# Altium project Weather_Data.PrjPcb (part 1 of 2)
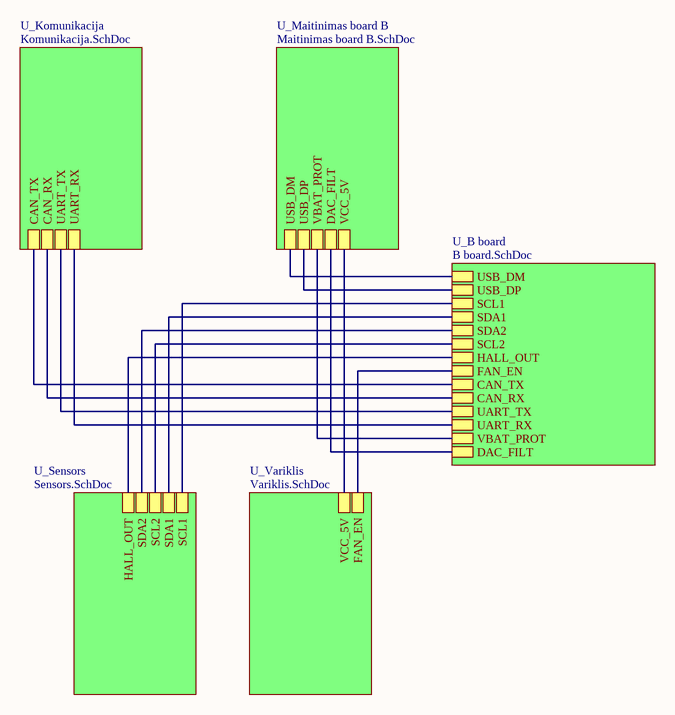
[diagram p0: B_Top.SchDoc]
6 sheets, 175 parts. Net scope: hierarchical (ports join the sheet entries above them; power ports are global).
Sheets:
  B_Top.SchDoc
    U_B board = B board.SchDoc
    U_Maitinimas board B = Maitinimas board B.SchDoc
    U_Komunikacija = Komunikacija.SchDoc
    U_Sensors = Sensors.SchDoc
    U_Variklis = Variklis.SchDoc

## Sheet B_Top.SchDoc
size A4; SheetNumber: 1; SheetTotal: 6

### Sub-sheets
U_B board = B board.SchDoc: USB_DM, USB_DP, SCL1, SDA1, SDA2, SCL2, HALL_OUT, FAN_EN, CAN_TX, CAN_RX, UART_TX, UART_RX, VBAT_PROT, DAC_FILT
U_Komunikacija = Komunikacija.SchDoc: CAN_TX, CAN_RX, UART_TX, UART_RX
U_Maitinimas board B = Maitinimas board B.SchDoc: USB_DM, USB_DP, VBAT_PROT, DAC_FILT, VCC_5V
U_Sensors = Sensors.SchDoc: SCL1, SDA1, SCL2, SDA2, HALL_OUT
U_Variklis = Variklis.SchDoc: FAN_EN, VCC_5V

### Nets
SCL1: sheet U_B board/SCL1, sheet U_Sensors/SCL1
SCL2: sheet U_B board/SCL2, sheet U_Sensors/SCL2
SDA1: sheet U_B board/SDA1, sheet U_Sensors/SDA1
SDA2: sheet U_B board/SDA2, sheet U_Sensors/SDA2
VBAT_PROT: sheet U_B board/VBAT_PROT, sheet U_Maitinimas board B/VBAT_PROT
VCC_5V: sheet U_Maitinimas board B/VCC_5V, sheet U_Variklis/VCC_5V
NetC17_2: sheet U_B board/DAC_FILT, sheet U_Maitinimas board B/DAC_FILT
NetIC1_4: sheet U_B board/USB_DM, sheet U_Maitinimas board B/USB_DM
NetIC1_6: sheet U_B board/USB_DP, sheet U_Maitinimas board B/USB_DP
NetIC2_2: sheet U_B board/HALL_OUT, sheet U_Sensors/HALL_OUT
NetIC5_4: sheet U_B board/UART_RX, sheet U_Komunikacija/UART_RX
NetIC5_6: sheet U_B board/UART_TX, sheet U_Komunikacija/UART_TX
NetR28_1: sheet U_B board/FAN_EN, sheet U_Variklis/FAN_EN
NetU4_35: sheet U_B board/CAN_TX, sheet U_Komunikacija/CAN_TX
NetU4_58: sheet U_B board/CAN_RX, sheet U_Komunikacija/CAN_RX

## Sheet B board.SchDoc
size A3; SheetNumber: 2; SheetTotal: 6
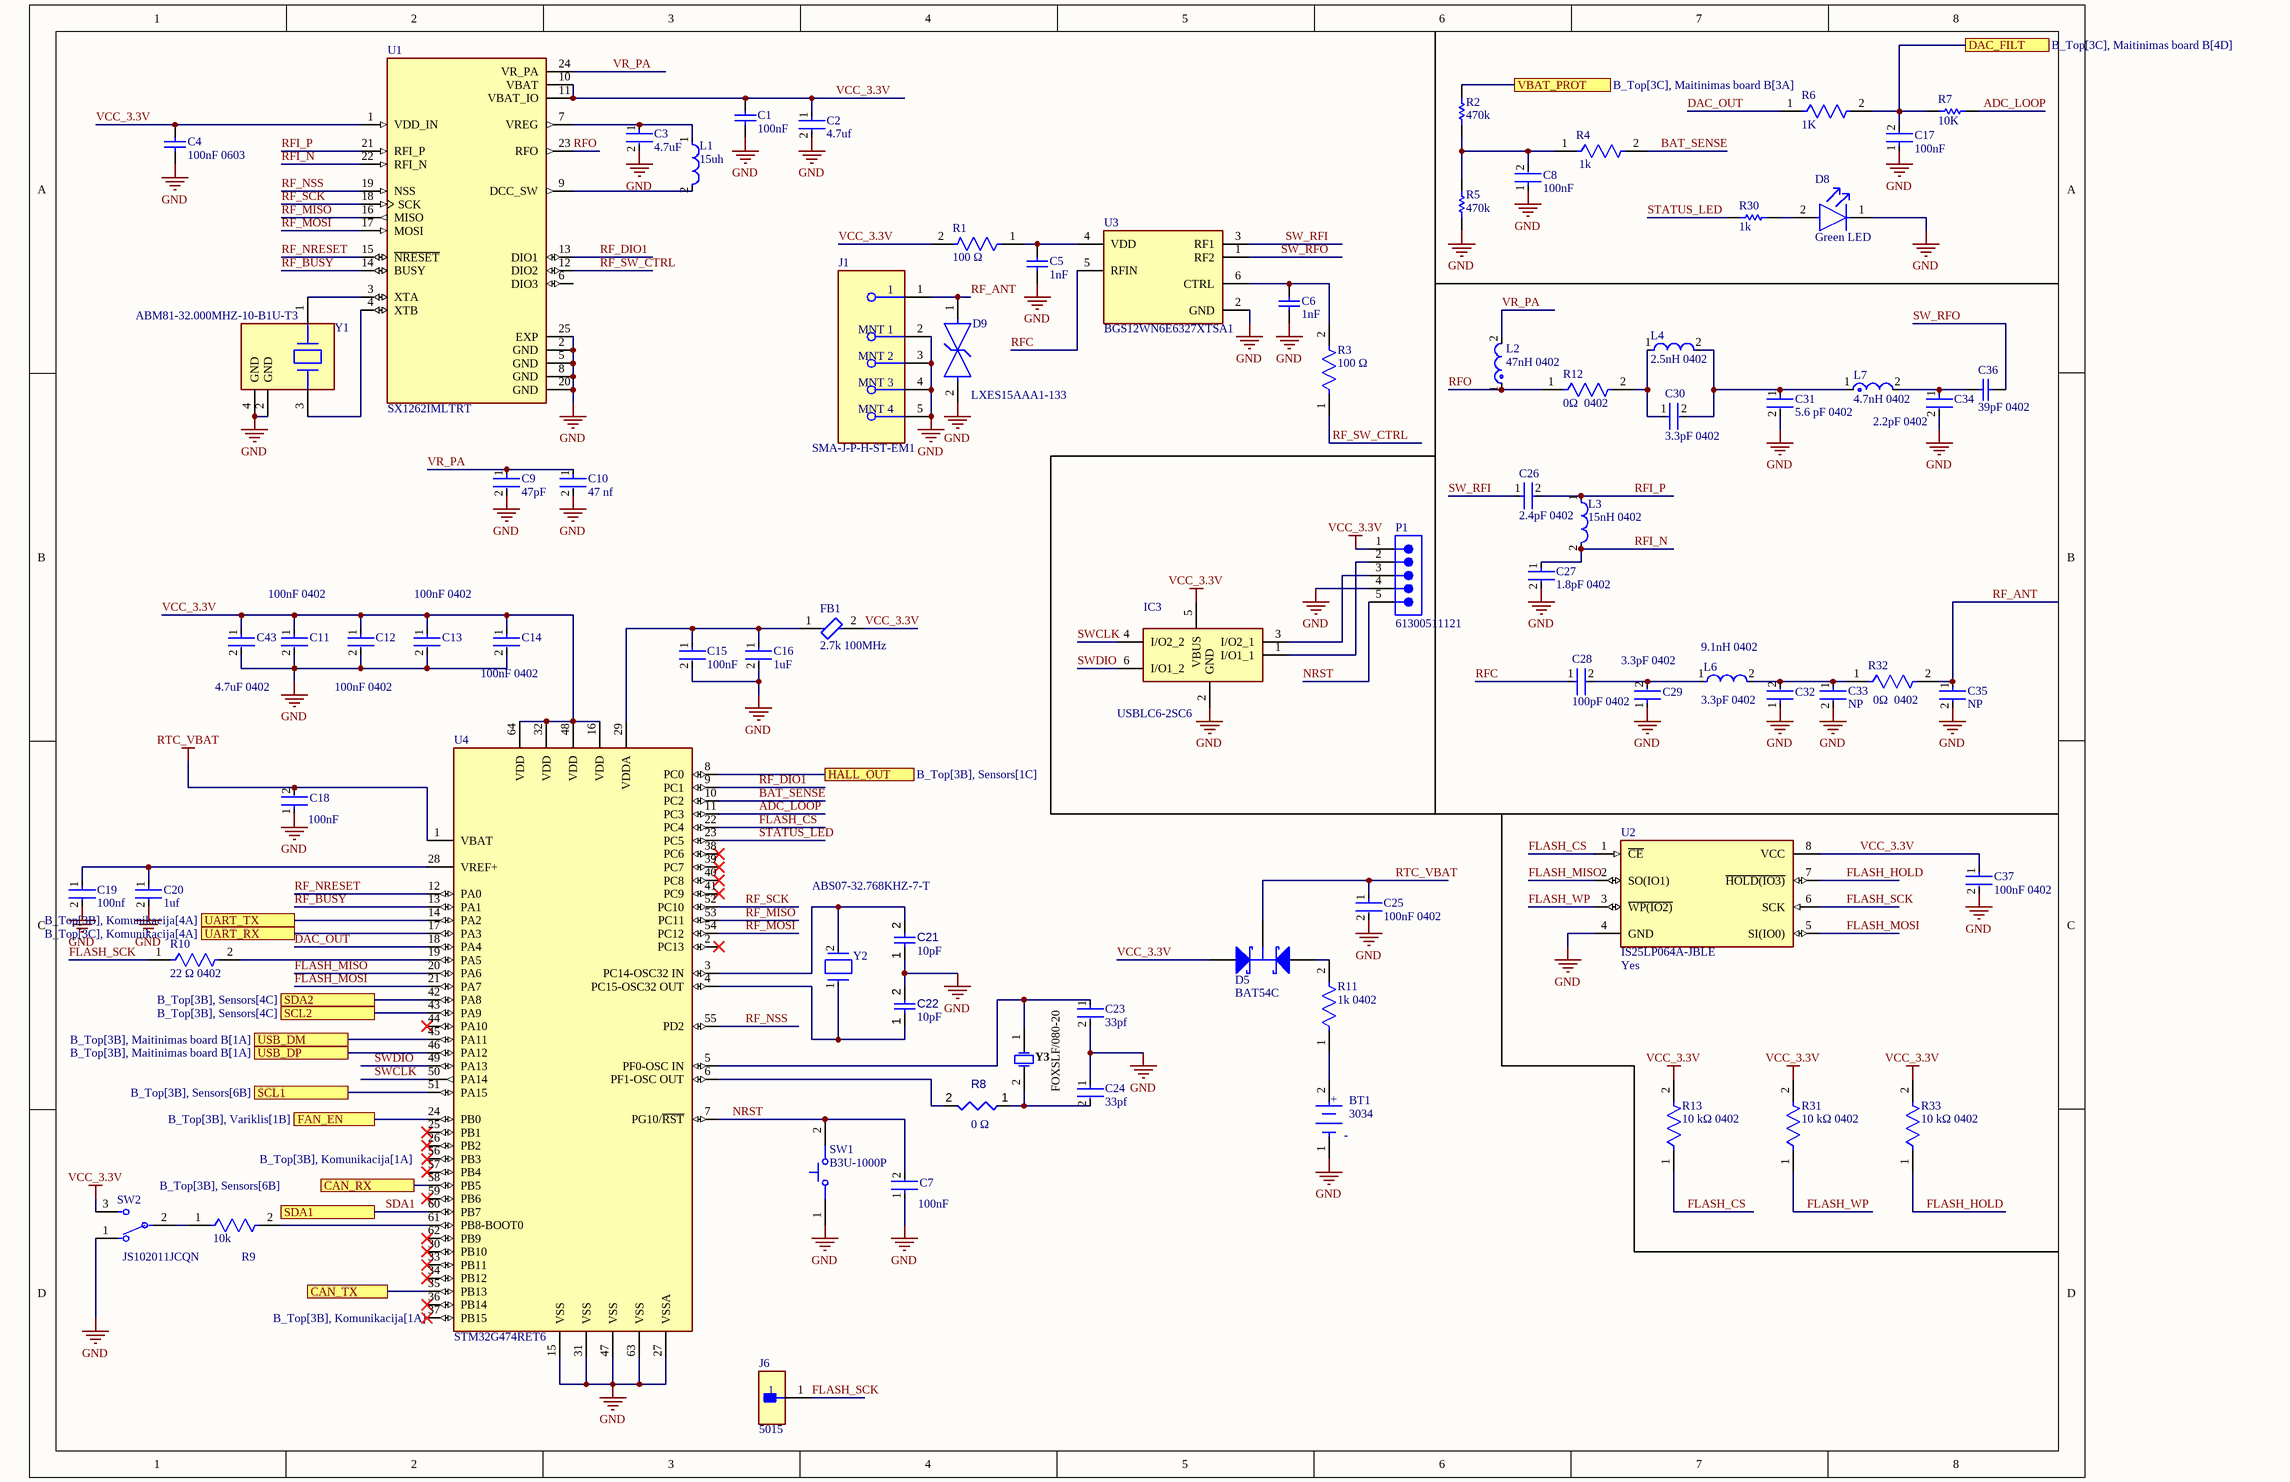
[diagram p1: B board.SchDoc]

### Parts
BT1  3034  [FP-3034-MFG]
C1  100nF  [CAPC1608X90X35NL15T15]
C2  4.7uf  [FP-CC1206-1_25-MFG]
C3  4.7uF  [FP-CC1206-1_25-MFG]
C4  100nF 0603  [CAPC1608X90X35NL15T15]
C5  1nF  [CAPC1005X60X30ML05T10]
C6  1nF  [CAPC1005X60X30ML05T10]
C7  100nF  [FP-GRT155-0_05-IPC_B]
C8  100nF  [FP-GRT155-0_05-IPC_B]
C9  47pF  [FP-CC0402-0_05-0_55-L2_0-MFG]
C10  47 nf  [FP-C0402-BB-MFG]
C11  100nF 0402  [FP-GRT155-0_05-IPC_B]
C12  100nF 0402  [FP-GRT155-0_05-IPC_B]
C13  100nF 0402  [FP-GRT155-0_05-IPC_B]
C14  100nF 0402  [FP-GRT155-0_05-IPC_B]
C15  100nF  [FP-GRT155-0_05-IPC_B]
C16  1uF  [FP-CL440-IPC_C]
C17  100nF  [FP-GRT155-0_05-IPC_B]
C18  100nF  [FP-GRT155-0_05-IPC_B]
C19  100nf  [FP-0402B104K500CT-IPC_C]
C20  1uf  [FP-CL858-IPC_C]
C21  value 10pF  [CAPC1608X90X40ML10T20]  (hidden comment: Capacitor 10 pF +/- 5% 50 V 0603)
C22  value 10pF  [CAPC1608X90X40ML10T20]  (hidden comment: Capacitor 10 pF +/- 5% 50 V 0603)
C23  33pf  [FP-CC0402-MFG]
C24  33pf  [FP-CC0402-MFG]
C25  100nF 0402  [FP-CC0402-MFG]
C26  2.4pF 0402  [FP-GJM155-0_05-IPC_A]
C27  1.8pF 0402  [FP-GJM155-0_05-IPC_B]
C28  100pF 0402  [FP-CC0402-MFG]
C29  3.3pF 0402  [FP-GJM155-0_05-IPC_B]
C30  3.3pF 0402  [FP-GJM155-0_05-IPC_B]
C31  5.6 pF 0402  [FP-GJM155-0_05-MFG]
C32  3.3pF 0402  [FP-GJM155-0_05-IPC_B]
C33  NP  [FP-GJM155-0_05-IPC_B]
C34  2.2pF 0402  [FP-GJM155-0_05-IPC_C]
C35  NP  [FP-GJM155-0_05-IPC_B]
C36  39pF 0402  [CAPC1005X55X25LL05T10]
C37  100nF 0402  [FP-CC0402-MFG]
C43  4.7uF 0402  [FP-CC0402-MFG]
D5  BAT54C  [NXP-SOT23-3_V]
D8  Green LED  [FP-LTST-C171GKT-MFG]
D9  LXES15AAA1-133  [FP-LXES15-MFG]
FB1  2.7k 100MHz  [FP-BLM21-0_2-t1_25-e0_3-IPC_A]
IC3  USBLC6-2SC6  [SOT95P280X145-6N]
J1  SMA-J-P-H-ST-EM1  [FP-SMA-J-P-H-ST-EM1-MFG]
J6  5015  [FP-5015-MFG]
L1  15uh  [FP-MLZ2012-1_25-IPC_C]
L2  47nH 0402  [FP-LQG15WH_02-IPC_C]
L3  15nH 0402  [FP-LQW15AN_00-W0_6-0_1-MFG]
L4  2.5nH 0402  [FP-LQW15AN_00-W0_6-0_1-MFG]
L6  9.1nH 0402  [FP-LQW15AN_00-W0_6-0_1-MFG]
L7  4.7nH 0402  [FP-LQG15HH_02-IPC_B]
P1  61300511121  [61300511121]
R1  100 Ω  [FP-CRGCQ0402-IPC_C]
R2  470k  [RESC1005X40X25ML10T10]
R3  100 Ω  [FP-CRGCQ0402-IPC_C]
R4  1k  [FP-CRGCQ0402-IPC_C]
R5  470k  [RESC1005X40X25ML10T10]
R6  1K  [FP-CRGCQ0402-IPC_C]
R7  10K  [RESC1005X40X25ML05T05]
R8  0 Ω  [RESC0402(1005)_L]
R9  10k  [FP-ESR01-MFG]
R10  22 Ω 0402  [FP-RMCF0402-MFG]
R11  1k 0402  [FP-CRCW0402-e3-MFG]
R12  0Ω  0402  [FP-CRCW0402-e3-IPC_C]
R13  10 kΩ 0402  [FP-AC0402-MFG]
R30  1k  [RESC1005X40X25ML10T10]
R31  10 kΩ 0402  [FP-AC0402-MFG]
R32  0Ω  0402  [FP-CRCW0402-e3-IPC_C]
R33  10 kΩ 0402  [FP-AC0402-MFG]
SW1  B3U-1000P  [OMRON-B3U-1000_V]
SW2  JS102011JCQN  [FP-JS102011JCQN-MFG]
U1  SX1262IMLTRT  [QFN50P400X400X100-25N]
U2  IS25LP064A-JBLE  RoHS Compliant: Yes  [FP-SOP-8-5280X5280DE-IPC_C]
U3  BGS12WN6E6327XTSA1  [FP-PG-TSNP-6-MFG]
U4  STM32G474RET6  [FP-LQFP64-5W-MFG]
Y1  ABM81-32.000MHZ-10-B1U-T3  [FP-ABM81-MFG]
Y2  ABS07-32.768KHZ-7-T  [FP-ABS07-MFG]
Y3  FOXSLF/080-20  [FOX-FOXSLF080-20]

### Ports
CAN_RX (see B_Top[3B], Komunikacija[1A]), CAN_TX (see B_Top[3B], Komunikacija[1A]), DAC_FILT (see B_Top[3C], Maitinimas board B[4D]), FAN_EN (see B_Top[3B], Variklis[1B]), HALL_OUT (see B_Top[3B], Sensors[1C]), SCL1 (see B_Top[3B], Sensors[6B]), SCL2 (see B_Top[3B], Sensors[4C]), SDA1 (see B_Top[3B], Sensors[6B]), SDA2 (see B_Top[3B], Sensors[4C]), UART_RX (see B_Top[3C], Komunikacija[4A]), UART_TX (see B_Top[3B], Komunikacija[4A]), USB_DM (see B_Top[3B], Maitinimas board B[1A]), USB_DP (see B_Top[3B], Maitinimas board B[1A]), VBAT_PROT (see B_Top[3C], Maitinimas board B[3A])

### Nets
GND: BT1.1(C) C1.1 C2.2 C3.2 C4.1 C5.1 C6.1 C7.1 C8.1 C9.2 C10.2 C11.2 C12.2 C13.2 C14.2 C15.2 C16.2 C17.1 C18.1 C19.2 C20.2 C21.1 C22.2 C23.2 C24.1 C25.2 C27.2 C29.1 C31.2 C32.1 C33.2 C34.2 C35.2 C37.2 C43.2 D8.1(C) D9.2 IC3.2(GND) J1.2(MNT_1) J1.3(MNT_2) J1.4(MNT_3) J1.5(MNT_4) P1.4 R5.1 SW1.1 SW2.1 U1.2(GND) U1.5(GND) U1.8(GND) U1.20(GND) U1.25(EXP) U2.4(GND) U3.2(GND) U4.15(VSS) U4.27(VSSA) U4.31(VSS) U4.47(VSS) U4.63(VSS) Y1.2(GND) Y1.4(GND)
RTC_VBAT: C18.2 C25.1 D5.3(K) U4.1(VBAT)
VCC_3.3V: C1.2 C2.1 C4.2 C11.1 C12.1 C13.1 C14.1 C37.1 C43.1 D5.1(A) FB1.2 IC3.5(VBUS) P1.1 R1.2 R13.2 R31.2 R33.2 SW2.3 U1.1(VDD_IN) U1.10(VBAT) U1.11(VBAT_IO) U2.8(VCC) U4.16(VDD) U4.32(VDD) U4.48(VDD) U4.64(VDD)
ADC_LOOP: R7.2 U4.11(PC3)
BAT_SENSE: R4.2 U4.10(PC2)
DAC_OUT: R6.1 U4.18(PA4)
FLASH_CS: R13.1 U2.1(~{CE}) U4.22(PC4)
FLASH_HOLD: R33.1 U2.7(~{HOLD(IO3)})
FLASH_MISO: U2.2(SO(IO1)) U4.20(PA6)
FLASH_MOSI: U2.5(SI(IO0)) U4.21(PA7)
FLASH_SCK: J6.1 R10.1 U2.6(SCK)
FLASH_WP: R31.1 U2.3(~{WP(IO2)})
NRST: C7.2 P1.5 SW1.2 U4.7(PG10/~{RST})
RF_ANT: C35.1 D9.1 J1.1 R32.2
RF_BUSY: U1.14(BUSY) U4.13(PA1)
RF_DIO1: U1.13(DIO1) U4.9(PC1)
RF_MISO: U1.16(MISO) U4.53(PC11)
RF_MOSI: U1.17(MOSI) U4.54(PC12)
RF_NRESET: U1.15(~{NRESET}) U4.12(PA0)
RF_NSS: U1.19(NSS) U4.55(PD2)
RF_SCK: U1.18(SCK) U4.52(PC10)
RF_SW_CTRL: R3.1 U1.12(DIO2)
RFC: C28.1 U3.5(RFIN)
RFI_N: C27.1 L3.2 U1.22(RFI_N)
RFI_P: C26.2 L3.1 U1.21(RFI_P)
RFO: L2.1 R12.1 U1.23(RFO)
SCL1: U4.51(PA15) ; port SCL1
SCL2: U4.43(PA9) ; port SCL2
SDA1: U4.60(PB7) ; port SDA1
SDA2: U4.42(PA8) ; port SDA2
STATUS_LED: R30.1 U4.23(PC5)
SW_RFI: C26.1 U3.3(RF1)
SW_RFO: C36.2 U3.1(RF2)
SWCLK: IC3.4(I/O2_2) U4.50(PA14)
SWDIO: IC3.6(I/O1_2) U4.49(PA13)
VBAT_PROT: R2.2 ; port VBAT_PROT
VR_PA: C9.1 C10.1 L2.2 U1.24(VR_PA)
NetBT1_2: BT1.2(A) R11.1
NetC3_1: C3.1 L1.1 U1.7(VREG)
NetC5_2: C5.2 R1.1 U3.4(VDD)
NetC6_2: C6.2 R3.2 U3.6(CTRL)
NetC8_2: C8.2 R2.1 R4.1 R5.2
NetC15_1: C15.1 C16.1 FB1.1 U4.29(VDDA)
NetC17_2: C17.2 R6.2 R7.1 ; port DAC_FILT
NetC19_1: C19.1 C20.1 U4.28(VREF+)
NetC21_2: C21.2 U4.3(PC14-OSC32_IN) Y2.2
NetC22_1: C22.1 U4.4(PC15-OSC32_OUT) Y2.1
NetC23_1: C23.1 U4.5(PF0-OSC_IN) Y3.1
NetC24_2: C24.2 R8.1 Y3.2
NetC28_2: C28.2 C29.2 L6.1
NetC30_1: C30.1 L4.1 R12.2
NetC30_2: C30.2 C31.1 L4.2 L7.1
NetC32_2: C32.2 C33.1 L6.2 R32.1
NetC34_1: C34.1 C36.1 L7.2
NetD5_2: D5.2(A) R11.2
NetD8_2: D8.2(A) R30.2
NetIC1_4: U4.45(PA11) ; port USB_DM
NetIC1_6: U4.46(PA12) ; port USB_DP
NetIC2_2: U4.8(PC0) ; port HALL_OUT
NetIC3_1: IC3.1(I/O1_1) P1.2
NetIC3_3: IC3.3(I/O2_1) P1.3
NetIC5_4: U4.17(PA3) ; port UART_RX
NetIC5_6: U4.14(PA2) ; port UART_TX
NetL1_2: L1.2 U1.9(DCC_SW)
NetR8_2: R8.2 U4.6(PF1-OSC_OUT)
NetR9_1: R9.1 SW2.2
NetR9_2: R9.2 U4.61(PB8-BOOT0)
NetR10_2: R10.2 U4.19(PA5)
NetR28_1: U4.24(PB0) ; port FAN_EN
NetU1_3: U1.3(XTA) Y1.1
NetU1_4: U1.4(XTB) Y1.3
NetU4_35: U4.35(PB13) ; port CAN_TX
NetU4_58: U4.58(PB5) ; port CAN_RX

Not connected (* = marked no-connect by the designer): U1 6(DIO3); U4 2(PC13)* 25(PB1)* 26(PB2)* 30(PB10)* 33(PB11)* 34(PB12)* 36(PB14)* 37(PB15)* 38(PC6)* 39(PC7)* 40(PC8)* 41(PC9)* 44(PA10)* 56(PB3)* 57(PB4)* 59(PB6)* 62(PB9)*

### Notes on the sheet
- (in symbol CMP-19636-000006-1) +; -

### Library data of the parts
BT1 = CMP-19636-000006-1: BATTERY RETAINER COIN 20MM SMD; Manufacturer: Keystone Electronics; Number Of Contacts: 2; Height: 4.31mm; Device Class L1: Connectors; Device Class L3: unset; RoHS: TRUE; Automotive: No; Mouser Description: Coin Cell Battery Holders COIN CELL RETAINER; Contact Material: Nickel; Digikey Description: BATTERY RETAINER COIN 20MM SMD; Category: Batt; Package: 3034; ComponentLink2URL: https://www.keyelco.com/product-pdf.cfm?p=798; Manufacturer Part Number: 3034; Octopart: https://octopart.com/3034-keystone-27554462; ComponentLink2Description: Datasheet; Device Class L2: unset; Lead Free: Yes
C1 C4 = CMP-2006-02299-1: Part Number: C0603C104K4RAC7013; Manufacturer: Kemet
C2 C3 = CMP-03422-000808-1: CC1206 4.7 uF X7R 10.00%25 V; Manufacturer Part Number: CC1206KFX7R8BB475; Manufacturer: Yageo; Automotive Grade: NA; Material: Ceramic; Voltage Rating: 25 V; Tolerance: 0.1; Temperature Coefficient: 15%; Device Class L2: Capacitors; Device Class L1: Passive Components; Category: Cap; Automotive: No; Capacitance: 4.7 uF; ComponentLink2URL: http://www.yageo.com/documents/recent/UPY-NP0X7R_HV_1KV-to-3KV_11.pdf; Octopart: https://octopart.com/cc1206kfx7r8bb475-yageo-80904472; Value: 4.7 uF; Footprint Url: http://www.yageo.com/exep/pages/download/literatures/UPY-C_GEN_24.pdf; Lead Free: Yes; Temperature Characteristic: X7R; ComponentLink2Description: Datasheet; Temperature Range Low: -55°C; Package: CC1206-1.25; RoHS: TRUE; Device Class L3: Ceramic Capacitors; Temperature: -55°C to +125°C; Height: 1.45mm; Temperature Range High: +125°C
C5 C6 = CMP-1034-01610-2: Part Number: C0402C102K9RACTU; Manufacturer: Kemet
C7 C8 C11-C15 C17 C18 = CMP-06035-021603-1: Multi-Layer Ceramic Capacitor 100nF 25V X7R ±10% 0402 Paper T/R
C9 = CMP-00621-00192874-1: CC0402JRNPO9BN470 Multilayer Ceramic Capacitor, 47 pF, 50 V, ± 5%, C0G (NP0), 0402 [1005 Metric]; NexarPartId: 192874; Temperature Coefficient: 30ppm/°C; Voltage: 50V; Insulation Resistance: 100GΩ; Termination: SMD/SMT; Thickness: 558.8µm; RoHS: Compliant; Length: 1mm; Halogen Free: Halogen Free; Lead Free: Lead Free; Material: Ceramic; Number of Pins: 2; REACH SVHC: No SVHC; Schedule B: 8532240020, 8532240020; Radiation Hardening: No; Weight: 652.039032µg; Capacitance: 47pF; Min Operating Temperature: -55°C; Case/Package: 0402; Height: 550µm; Voltage Rating (DC): 50V; Composition: Ceramic; Case Code (Imperial): 0402; Max Operating Temperature: 125°C; Voltage Rating (AC): 50V; Dielectric Material: Ceramic; Voltage Rating: 50V; Mount: Surface Mount; Tolerance: 5%; Dielectric: C0G; Depth: 500µm; Case Code (Metric): 1005
C10 = CMP-03020-011259-1: CAP CER 0.047UF 16V X7R 0402; Manufacturer Part Number: C0402C473K4RACAUTO; Manufacturer: Kemet; Temperature Coefficient: 15%; Capacitance: 47,000 pF; Material: Ceramic; Tolerance: 0.1; Value: 47,000 pF; Voltage Rating: 16 V; Mouser Description: Cap Ceramic 0.047uF 16V X7R 10% Pad SMD 0402 125°C Automotive T/R; ComponentLink2Description: Datasheet; Temperature Range Low: -55°C; Ipc Land Pattern Name: CAPC10050X50; Digikey Description: CAP CER 0.047UF 16V X7R 0402; Device Class L2: Capacitors; Height: 0.55mm; ComponentLink2URL: https://content.kemet.com/datasheets/KEM_C1002_X7R_SMD.pdf; Temperature Characteristic: X7R; Lead Free: Yes; Octopart: https://octopart.com/c0402c473k4racauto-kemet-33302865; Device Class L1: Passive Components; Temperature: -55°C to +125°C; Category: Cap; Package: C0402-BB; Automotive: No; Temperature Range High: +125°C; Device Class L3: Ceramic Capacitors; RoHS: TRUE
C16 = CMP-13271-000031-1: Cap Ceramic 1uF 35V X5R ±10% SMD 0402 +85°C Paper T/R; Voltage Rating: 35V; Mount: Surface Mount; Case Code (Metric): 1005; Thickness: 0.022inch; Capacitance: 1uF; Max Operating Temperature: 85°C; Width: 0.02inch; Tolerance: 10%; Length: 0.039inch; Packaging: Tape and Reel; Case Code (Imperial): 0402; Min Operating Temperature: -55°C; Case/Package: 0402
C19 = CMP-45632-000010-1: CAP CER 0.1UF 50V X7R 0402; Tolerance: 10%; Max Operating Temperature: 125°C; Case Code (Metric): 1005; RoHS Compliant: Yes; Series: -; Case Code (Imperial): 0402; Voltage Rating: 50V; Min Operating Temperature: -55°C; Mount: Surface Mount; Capacitance: 100nF; Case/Package: 0402; Packaging: Cut Tape
C20 = CMP-13271-003231-1: Cap Ceramic 1uF 6.3V X6S ±10% SMD 0402 +105°C Paper T/R; Mount: Surface Mount; Voltage Rating: 6.3V; Min Operating Temperature: -55°C; Case/Package: 0402; Thickness: 0.022inch; Radiation Hardening: No; Capacitance: 1uF; Contact Plating: Tin; Max Operating Temperature: 105°C; Length: 1mm; Tolerance: 10%; Dielectric: X6S; Height: 0.5mm; Depth: 0.5mm; Case Code (Imperial): 0402; Package Quantity: 1; Width: 0.02inch; Case Code (Metric): 1005; Packaging: Tape and Reel
C21 C22 = CMP-001-00014-6: Chip Capacitor, 10 pF, +/- 5%, 50 V, 0603 (1608 Metric); Capacitor Type: Ceramic; Voltage Rating: 50V; RoHS Compliant: True; Case/Package: 0603; Max Operating Temperature: 125°C; Pins: 2; Tolerance: 5%; Mounting Technology: SM; Min Operating Temperature: -55°C
C23 C24 = CMP-03422-000353-1: CAP CER 33PF 50V C0G/NPO 0402; Manufacturer: YAGEO; Manufacturer Part Number: CC0402JRNPO9BN330; Tolerance: 5%; Automotive Grade: NA; Material: Ceramic; Temperature Characteristic: NP0; Temperature Coefficient: 30ppm/°C; ComponentLink2Description: Datasheet; Category: Cap; Height: 0.55mm; Device Class L3: Ceramic Capacitors; Lead Free: Yes; Temperature Range High: +125°C; Device Class L1: Passive Components; Automotive: No; Device Class L2: Capacitors; RoHS: TRUE; Digikey Description: CAP CER 33PF 50V C0G/NPO 0402; Octopart: https://octopart.com/cc0402jrnpo9bn330-yageo-39467613; Mouser Description: Multilayer Ceramic Capacitors MLCC - SMD/SMT 33pF 50V NPO 5%; Temperature: -55°C to +125°C; Value: 33pF; Temperature Range Low: -55°C; Package: CC0402; Capacitance: 33pF; Footprint Url: http://www.yageo.com/exep/pages/download/literatures/UPY-C_GEN_24.pdf; Ipc Land Pattern Name: CAPC10050X50; Voltage Rating: 50V; ComponentLink2URL: http://www.yageo.com/documents/recent/UPY-GP_NP0_16V-to-50V_16.pdf
C25 C37 = CMP-03422-001010-1: CAP CER 0.1UF 50V X7R 0402; Manufacturer: YAGEO; Manufacturer Part Number: CC0402KRX7R9BB104; Temperature Coefficient: 30ppm/°C; Material: Ceramic; Automotive Grade: NA; Tolerance: 0.1; Footprint Url: http://www.yageo.com/exep/pages/download/literatures/UPY-C_GEN_24.pdf; Category: Cap; Capacitance: 100 nF; Package: CC0402; Voltage Rating: 50 V; ComponentLink2Description: Datasheet; Temperature Characteristic: X7R; Device Class L1: Passive Components; Device Class L2: Capacitors; Digikey Description: CAP CER 0.1UF 50V X7R 0402; Octopart: https://octopart.com/cc0402krx7r9bb104-yageo-56536067; Device Class L3: Ceramic Capacitors; Height: 0.55mm; Temperature: -55°C to +125°C; Temperature Range High: +125°C; Value: 100 nF; ComponentLink2URL: http://www.yageo.com/documents/recent/UPY-GP_NP0_16V-to-50V_16.pdf; Temperature Range Low: -55°C; RoHS: TRUE; Ipc Land Pattern Name: CAPC10050X50; Lead Free: Yes; Automotive: No
C26 = CMP-2008-03838-2: Multi-Layer Ceramic Capacitor 2.4pF C0G  ±0.1pF 0402 Paper T/R; Voltage Rating: 50V; Height: 0.5mm; Dielectric: C0G; Thickness: 0.022inch; Case Code (Imperial): 0402; Width: 0.02inch; Max Operating Temperature: 125°C; Length: 1mm; Radiation Hardening: No; Min Operating Temperature: -55°C; Case/Package: 0402; Voltage Rating (DC): 50V; Depth: 0.5mm; Voltage: 50V; Mount: Surface Mount; Capacitance: 2.4pF; Termination: SMD/SMT; Lead Free: Lead Free; Package Quantity: 1; Packaging: Tape and Reel; Case Code (Metric): 1005
C27 = CMP-2008-03827-2: Multi-Layer Ceramic Capacitor 1.8pF C0G  ±0.05pF 0402 Paper T/R; Voltage Rating: 50V; Depth: 0.5mm; Length: 1mm; Case Code (Imperial): 0402; Case/Package: 0402; Min Operating Temperature: -55°C; Width: 0.5mm; Voltage Rating (DC): 50V; Termination: SMD/SMT; Case Code (Metric): 1005; Dielectric: C0G; Height: 0.5mm; Max Operating Temperature: 125°C; Lead Free: Lead Free; Thickness: 0.022inch; Packaging: Tape and Reel; Mount: Surface Mount; Radiation Hardening: No; Capacitance: 1.8pF; Package Quantity: 10000
C28 = CMP-03422-000275-1: CAP CER 100PF 25V X7R 0402; Manufacturer Part Number: CC0402KRX7R8BB101; Manufacturer: YAGEO; Material: Ceramic; Tolerance: 0.1; Automotive Grade: NA; Temperature Coefficient: 30ppm/°C; ComponentLink2Description: Datasheet; Device Class L2: Capacitors; Digikey Description: CAP CER 100PF 25V X7R 0402; Category: Cap; Ipc Land Pattern Name: CAPC10050X50; Height: 0.55mm; Lead Free: Yes; Temperature Range High: +125°C; Octopart: https://octopart.com/cc0402krx7r8bb101-yageo-71334371; Automotive: No; Device Class L3: Ceramic Capacitors; ComponentLink2URL: http://www.yageo.com/documents/recent/UPY-GP_NP0_16V-to-50V_16.pdf; Value: 100 pF; Voltage Rating: 25 V; Temperature: -55°C to +125°C; Capacitance: 100 pF; Temperature Characteristic: X7R; Footprint Url: http://www.yageo.com/exep/pages/download/literatures/UPY-C_GEN_24.pdf; Mouser Description: 0402 100 pF ±10% Tolerance X7R Multilayer Ceramic Chip Capacitor; Device Class L1: Passive Components; Temperature Range Low: -55°C; RoHS: TRUE; Package: CC0402
C29 C30 C32 = CMP-2008-03847-2: Multi-Layer Ceramic Capacitor 3.3pF C0G  ±0.25pF 0402 Paper T/R; Voltage: 50V; Length: 1mm; Dielectric: C0G; Capacitance: 3.3pF; Case Code (Metric): 1005; Max Operating Temperature: 125°C; Min Operating Temperature: -55°C; Case/Package: 0402; Package Quantity: 1; Termination: SMD/SMT; Thickness: 0.022inch; Width: 0.5mm; Mount: Surface Mount; Voltage Rating (DC): 50V; Height: 0.5mm; Voltage Rating: 50V; Lead Free: Lead Free; Radiation Hardening: No; Case Code (Imperial): 0402; Depth: 0.5mm; Packaging: Tape and Reel
C31 = CMP-2008-03865-2: Multi-Layer Ceramic Capacitor 5.6pF C0G  ±0.1pF 0402 Paper T/R; Voltage Rating (DC): 50V; Max Operating Temperature: 125°C; Capacitance: 5.6pF; Mount: Surface Mount; REACH SVHC: No SVHC; Case Code (Metric): 1005; Case/Package: 0402; Packaging: Tape and Reel; Min Operating Temperature: -55°C; Number of Pins: 2; Radiation Hardening: No; Package Quantity: 10000; Lead Pitch: 0.3mm; Width: 0.5mm; Voltage Rating: 50V; Thickness: 0.022inch; Length: 1mm; Termination: SMD/SMT; Height: 0.5mm; Case Code (Imperial): 0402; Depth: 0.5mm; Dielectric: C0G
C33 C35 = CMP-2008-03808-2: Multi-Layer Ceramic Capacitor 1pF C0G  ±0.1pF 0402 Paper T/R; Temperature Coefficient: 30ppm/°C; Voltage Rating (DC): 50V; REACH SVHC: No SVHC; Packaging: Tape and Reel; Width: 0.02inch; Package Quantity: 10000; Min Operating Temperature: -55°C; Case Code (Imperial): 0402; Lead Pitch: 0.3mm; Capacitance: 1pF; Length: 1mm; Max Operating Temperature: 125°C; Depth: 0.5mm; Thickness: 0.022inch; Case Code (Metric): 1005; Lead Free: Lead Free; Voltage: 50V; Mount: Surface Mount; Number of Pins: 2; Termination: SMD/SMT; Radiation Hardening: No; Dielectric: C0G; Case/Package: 0402; Voltage Rating: 50V; Height: 0.5mm
C34 = CMP-2008-03835-2: Multi-Layer Ceramic Capacitor 2.2pF C0G  ±0.1pF 0402 Paper T/R; Voltage Rating: 50V; Temperature Coefficient: 30ppm/°C; Width: 0.5mm; Dielectric: C0G; Mount: Surface Mount; Thickness: 0.022inch; Lead Pitch: 0.3mm; Depth: 0.5mm; Case Code (Metric): 1005; Lead Free: Lead Free; Min Operating Temperature: -55°C; Number of Pins: 2; Radiation Hardening: No; Case/Package: 0402; Voltage: 50V; Max Operating Temperature: 125°C; Height: 0.5mm; Package Quantity: 10000; Capacitance: 2.2pF; REACH SVHC: No SVHC; Packaging: Tape and Reel; Case Code (Imperial): 0402; Termination: SMD/SMT; Voltage Rating (DC): 50V; Length: 1mm
C36 = CMP-2008-03921-1: Part Number: GRM1555C1H390JA01D; Manufacturer: Murata
C43 = CMP-03422-000823-1: CAP CER 4.7UF 10V X5R 0402; Manufacturer Part Number: CC0402KRX5R6BB475; Manufacturer: YAGEO; Material: Ceramic; Automotive Grade: NA; Temperature Coefficient: 30ppm/°C; Tolerance: 0.1; Value: 4.7 uF; Footprint Url: http://www.yageo.com/exep/pages/download/literatures/UPY-C_GEN_24.pdf; Automotive: No; Temperature: -55°C to +125°C; Device Class L3: Ceramic Capacitors; Temperature Range High: +125°C; Temperature Range Low: -55°C; Mouser Description: CC Series 0402 4.7 uF 10 V ±10% Tolerance X5R Multilayer Ceramic Capacitor; Package: CC0402; RoHS: TRUE; Category: Cap; Voltage Rating: 10 V; Octopart: https://octopart.com/cc0402krx5r6bb475-yageo-77039651; ComponentLink2Description: Datasheet; Ipc Land Pattern Name: CAPC10050X50; Capacitance: 4.7 uF; Digikey Description: CAP CER 4.7UF 10V X5R 0402; Device Class L1: Passive Components; Height: 0.55mm; Lead Free: Yes; Temperature Characteristic: X5R; ComponentLink2URL: http://www.yageo.com/documents/recent/UPY-GP_NP0_16V-to-50V_16.pdf; Device Class L2: Capacitors
D5 = CMP-0417-00003-1: Schottky Barrier Diode, 30 V, 2 uA, -55 to 150 degC, 3-Pin SOT23, RoHS, Tape and Reel; Manufacturer: NXP Semiconductors; IR (uA): 2; VF (mV): 800; Trr (ns): 5; Cd (pF): 10; VR (V): 30; Rth(j-a) (K/W): 500; RoHS: TRUE; Packing: Tape and Reel; ComponentLink2URL: http://www.nxp.com/documents/data_sheet/BAT54_SER.pdf; PartNumber: BAT54C; ComponentLink2Description: Datasheet; Temperature Range: -55 to 150 degC; PackageReference: SOT23-3; PackageDescription: 3-Pin Plastic Surface-mounted Package, Body 1.3 x 2.9 mm, Pitch 0.95 mm; Mounting Technology: Surface Mount; ComponentLink1URL: http://www.nxp.com/; DatasheetVersion: Rev. 5; ComponentLink1Description: Manufacturer URL
D8 = CMP-22017-000007-1: LED GREEN CLEAR CHIP SMD; Luminous Intensity: 12mcd; Lens Color: Colorless; Dominant Wavelength: 569nm; Number of LEDs: 1; Power Dissipation: 100mW; Viewing Angle: 130°; Reverse Voltage: 5V; Test Current: 10mA; Forward Voltage: 2.1V; Wavelength: 585nm; Lens Style: Diffused; Forward Current: 30mA; Height: 0.8mm; Mount: Surface Mount; Package Quantity: 1; Length: 2mm; Case Code (Metric): 2012; Number of Pins: 2; Number of Elements: 1; Packaging: Tape and Reel; Color: Green; Min Operating Temperature: -55°C; Case/Package: 0805; Power Rating: 100mW; Max Operating Temperature: 85°C; Radiation Hardening: No; Depth: 1.25mm; Lens Transparency: Clear; Width: 1.25mm; Lead Free: Lead Free; Case Code (Imperial): 0805; Illumination Color: Green
D9 = CMP-06195-000011-1: TVS DIODE 15V 1005; Number of Bidirectional Channels: 1; Power Line Protection: No; Mount: Surface Mount; Case Code (Metric): 1005; Min Operating Temperature: -40°C; Case Code (Imperial): 0402; Resistor Type: Zener; Reverse Standoff Voltage: 15V; Case/Package: 0402; Packaging: Tape and Reel; Max Operating Temperature: 85°C
FB1 = CMP-06046-001048-1: FERRITE BEAD 2700 OHM 0201 1LN
IC3 = USBLC6-2SC6: Integrated Circuit; Manufacturer_Name: STMicroelectronics; Datasheet Link: https://www.st.com/resource/en/datasheet/usblc6-2.pdf; Height: 1.45mm; Manufacturer_Part_Number: USBLC6-2SC6; Mouser Part Number: 511-USBLC6-2SC6; Mouser Price/Stock: https://www.mouser.co.uk/ProductDetail/STMicroelectronics/USBLC6-2SC6?qs=po45yt2pPpu%2FhNIlwQdTlg%3D%3D; Arrow Part Number: USBLC6-2SC6; Arrow Price/Stock: https://www.arrow.com/en/products/usblc6-2sc6/stmicroelectronics.html?utm_currency=USD&region=asia
J1 = CMP-02754-000006-1: CONN SMA JACK STR 50OHM EDGE MNT; Dielectric Material: PTFE; Center Contact Plating: Gold; Max Frequency: 6GHz; Body Material: Brass; Voltage Rating: 335V; Impedance: 50R; Package Quantity: 1; Case/Package: SMA; Max Operating Temperature: 125°C; Fastening Type: Threaded; Orientation: Straight; Depth: 13.33mm; RoHS Compliant: Yes; Length: 6.35mm; Insulation Material: Polytetrafluoroethylene; Termination: Solder; Min Operating Temperature: -65°C; Housing Color: Gold; Contact Plating: Gold; Contact Material: Copper; Connector Type: SMA; Mount: Edge; Series: SMA; Packaging: Tray; Body Plating: Gold; Radiation Hardening: No
J6 = CMP-2000-05183-2: PC TEST POINT MINIATURE; Manufacturer: keystone; Number Of Contacts: 1; Conn Orientation: Straight; Category: Conn; Manufacturer Part Number: 5015; Digikey Description: PC TEST POINT MINIATURE; Automotive: No; Lead Free: Yes; Octopart: https://octopart.com/5015-keystone-3822; ComponentLink2URL: http://www.keyelco.com/product-pdf.cfm?p=1353; Package: 5015; RoHS: TRUE; Device Class L3: unset; Device Class L2: unset; Contact Material: Silver; Device Class L1: Connectors; Height: 1.65mm; ComponentLink2Description: Datasheet
L1 = CMP-08253-000252-1: Shielded Multilayer Inductor 15uH ±20% 250mA 1235mΩ SMD 0805; Core Material: Ferrite; Saturation Current: 120mA; DC Resistance (DCR): 1.235R; Test Frequency: 2MHz; Self Resonant Frequency: 40MHz; Case/Package: 0805; Mount: Surface Mount; Package Quantity: 1; Current Rating: 250mA; Inductance: 15uH; Case Code (Metric): 2012; Max Operating Temperature: 125°C; Height - Seated (Max): 0.057inch; Width: 0.049inch; Length: 0.079inch; Shielding: Shielded; RoHS Compliant: Yes; Case Code (Imperial): 0805; Packaging: Tape and Reel; Min Operating Temperature: -55°C; Tolerance: 20%
L2 = CMP-06042-012463-1: Multilayer type Inductor for Automotive 47nH ±2% 1.6Ω 190mA 0402
L3 = CMP-06042-012641-1: Wire Wound RF Inductor 15nH ±2% 460mA 0.16Ω 0402 (1005); Core Material: Non-Magnetic; Current: 310mA; Self Resonant Frequency: 5GHz; Test Frequency: 100MHz; DC Resistance (DCR): 160mR; Shielding: Unshielded; Length: 1mm; REACH SVHC: No SVHC; Case Code (Imperial): 0402; Packaging: Tape and Reel; Case/Package: 0402; Weight: 2.8E-05oz; Current Rating: 460mA; Termination: SMD/SMT; Height - Seated (Max): 0.024inch; Inductance Tolerance: 2%; Height: 0.5mm; Military Standard: Not; Tolerance: 2%; Width: 0.5mm; Depth: 0.7mm; Min Operating Temperature: -55°C; Number of Pins: 2; Lead Free: Lead Free; Case Code (Metric): 1005; Max DC Current: 460mA; Max Operating Temperature: 125°C; Package Quantity: 10000; Mount: Surface Mount; Radiation Hardening: No; Resistor Type: Wirewound; DC Current: 460mA; Inductance: 15nH
L4 = CMP-06042-007620-1: Wire Wound RF Inductor 2.5nH ±0.1nH 850mA 0.05Ω 0402 (1005); Self Resonant Frequency: 15GHz; Core Material: Air; Q Factor: 20; DC Resistance (DCR): 50mR; Test Frequency: 100MHz; Shielding: Unshielded; Min Operating Temperature: -55°C; Case/Package: 0402; Military Standard: Not; Mount: Surface Mount; Packaging: Tape and Reel; Radiation Hardening: No; Height - Seated (Max): 0.024inch; Current Rating: 850mA; Inductance: 2.5nH; Height: 0.5mm; Max DC Current: 850mA; Case Code (Metric): 1005; Weight: 2.8E-05oz; Case Code (Imperial): 0402; Length: 1mm; Depth: 0.7mm; REACH SVHC: No SVHC; Width: 0.5mm; Max Operating Temperature: 125°C; Termination: SMD/SMT; Package Quantity: 1; Resistor Type: Wirewound; DC Current: 850mA
L6 = CMP-06042-009985-1: Wire Wound RF Inductor 9.1nH ±2% 540mA 0.14Ω 0402 (1005); Test Frequency: 100MHz; DC Resistance (DCR): 140mR; Core Material: Air; Shielding: Unshielded; Self Resonant Frequency: 5.5GHz; Q Factor: 25; Mount: Surface Mount; Length: 1mm; Width: 0.02inch; Packaging: Tape and Reel; Package Quantity: 1; Case Code (Imperial): 0402; Case/Package: 0402; Depth: 0.7mm; Number of Pins: 2; Min Operating Temperature: -55°C; Max DC Current: 540mA; DC Current: 540mA; REACH SVHC: No SVHC; Height: 0.5mm; Case Code (Metric): 1005; Max Operating Temperature: 125°C; Termination: SMD/SMT; Tolerance: 2%; Current Rating: 540mA; Inductance Tolerance: 2%; Weight: 2.8E-05oz; Military Standard: Not; Lead Free: Lead Free; Inductance: 9.1nH; Radiation Hardening: No
L7 = CMP-06042-003214-1: Multilayer type RF Inductor 4.7nH ±0.2nH 0.16Ω 700mA 0402; Self Resonant Frequency: 6GHz; Core Material: Air; DC Resistance (DCR): 160mR; Shielding: Unshielded; Test Frequency: 100MHz; Case Code (Metric): 1005; Packaging: Cut Tape; Case Code (Imperial): 0402; Max Operating Temperature: 125°C; Current Rating: 700mA; Inductance: 4.7nH; Mount: Surface Mount; Case/Package: 0402; Min Operating Temperature: -55°C
P1 = CMP-1502-01068-4: THT Vertical Pin Header WR-PHD, Pitch 2.54 mm, Single Row, 5 pins; Number of Contacts: 5; Connector Type: Male Pin; Operating Supply Voltage: 250V; Contact Resistance: 20mΩ; Gender: Male; Pitch: 2.54mm; Current Rating: 3A; Min Operating Temperature: -40°C; Contact Material: Gold; Color: Black; RoHS: Compliant; Number of Rows: 1; Lead Free: Lead Free; Height: 8.89mm; Contact Plating: Gold; Number of Pins: 5; Orientation: Vertical; Voltage Rating: 250V; Packaging: Bulk; Number of Positions: 5; Max Operating Temperature: 105°C; Termination: Solder; Lead Pitch: 2.54mm; Contact Mating Length: 5.9944mm; Mount: Through Hole
R1 R3 = CMP-03211-004684-1: CRGCQ 0402 100R 5%; Manufacturer Part Number: CRGCQ0402J100R; Manufacturer: TE Connectivity; Value: 100Ω; Power Rating: 0.0625W; Temperature Coefficient: ±200ppm/°C; Voltage Rating: 50V; Tolerance: 0.05; RoHS: TRUE; ComponentLink2Description: Datasheet; Lead Free: Yes; Temperature: -55°C to +155°C; Series: CRGCQ; Package: CRGCQ0402; Composition: Thick Film; Digikey Description: CRGCQ 0402 100R 5%; Device Class L1: Passive Components; Temperature Range High: +155°C; Octopart: https://octopart.com/crgcq0402j100r-te+connectivity-91017992; Ambient Temperature Range High: +70°C; Device Class L3: Chip SMD Resistors; Automotive: Yes; ComponentLink2URL: https://www.te.com/commerce/DocumentDelivery/DDEController?Action=showdoc&DocId=Data+Sheet%7F1773204-3%7F1%7Fpdf%7FEnglish%7FENG_DS_1773204-3_1.pdf%7F4-2176347-467; Height: 0.4mm; Temperature Range Low: -55°C; Mouser Description: Res, Auto, Thick Film, 100R, 5%, 0402; Category: Res; Ipc Land Pattern Name: RESC10050X35; Resistance: 100Ω; Device Class L2: Resistors
R2 R5 = CMP-2002-03899-1: Part Number: RK73H1ETTP4703F; Manufacturer: KOA Speer
R4 R6 = CMP-03211-006314-1: CRGCQ0402 1KΩ 1% ±100ppm/°C 50V; Manufacturer Part Number: CRGCQ0402F1K0; Manufacturer: TE Connectivity; Power Rating: 0.0625W; Tolerance: 0.01; Composition: Thick Film; Voltage Rating: 50V; Device Class L2: Resistors; Package: CRGCQ0402; Temperature Range High: +155°C; Device Class L3: Chip SMD Resistors; Automotive: Yes; Value: 1KΩ; Ambient Temperature Range High: +70°C; Temperature Range Low: -55°C; Temperature: -55°C to +155°C; Resistance: 1KΩ; Device Class L1: Passive Components; Height: 0.4mm; Series: CRGCQ; Lead Free: Yes; ComponentLink2URL: https://www.te.com/commerce/DocumentDelivery/DDEController?Action=showdoc&DocId=Data+Sheet%7F1773204-3%7F1%7Fpdf%7FEnglish%7FENG_DS_1773204-3_1.pdf%7F4-2176347-694; Category: Res; Octopart: https://octopart.com/crgcq0402f1k0-te+connectivity-91017946; RoHS: TRUE; ComponentLink2Description: Datasheet; Ipc Land Pattern Name: RESC10050X35; Temperature Coefficient: ±100ppm/°C
R7 = CMP-2002-01181-1: Manufacturer: Panasonic; Part Number: ERT-J0EM103J
R8 = CMP-009-00062-2: Jumper 0402 (1005 Metric); Pins: 2; Value: 0 Ω; Mounting Technology: SMT; Case/Package: 0402
R9 = CMP-08839-028483-1: 10kΩ ±1% 0.2W 0402 Anti-Surge Chip Resistor AEC-Q200; Resistance: 10kR; Temperature Coefficient: 100ppm/°C; Max Power Dissipation: 200mW; Number of Terminations: 2; Max Operating Temperature: 155°C; Package Quantity: 10000; Resistor Type: Thick Film; Case/Package: 0402; Series: ESR01; Packaging: Tape and Reel; Height: 0.016inch; Tolerance: 1%; Min Operating Temperature: -55°C; RoHS Compliant: Yes; Length: 0.039inch; Width: 0.02inch
R10 = CMP-26527-006952-1: 22Ω ±1% 0.063W 0402 Thick Film Chip Resistor AEC-Q200 compliant; Temperature Coefficient: 100ppm/°C; Resistance: 22R; Max Power Dissipation: 63mW; RoHS Compliant: Yes; Min Operating Temperature: -55°C; Features: Automotive AEC-Q200; Max Operating Temperature: 155°C; Number of Terminations: 2; Length: 0.039inch; Height: 0.016inch; Tolerance: 1%; Packaging: Tape and Reel; Width: 0.02inch; Resistor Type: Thick Film; Contact Plating: Tin; Case/Package: 0402; Series: RMCF; Mount: Surface Mount
R11 = CMP-2002-08276-2: RES Thick Film, 1kΩ, 1%, 0.063W, 100ppm/°C, 0402; Resistance: 1kR; Power Rating: 63mW; Voltage Rating (DC): 50V; Package Quantity: 10; Termination: SMD/SMT; Width: 0.5mm; Military Standard: Not; Length: 1mm; Contact Plating: Tin; Mount: Surface Mount; Packaging: Tape and Reel; Case Code (Imperial): 0402; Tolerance: 1%; Weight: 2.3E-05oz; Number of Pins: 2; Case/Package: 0402; Case Code (Metric): 1005; Lead Free: Lead Free; Number of Terminations: 2; Max Power Dissipation: 63mW; Depth: 0.5mm; Temperature Coefficient: 100ppm/°C; Max Operating Temperature: 155°C; Height: 0.35mm; Features: Automotive AEC-Q200; Composition: Thick Film; Radiation Hardening: No; Voltage Rating: 50V; Min Operating Temperature: -55°C
R12 R32 = CMP-2002-08122-2: RES Thick Film, 0Ω, 0.063W, 0402; Tolerance: 5%; Max Power Dissipation: 63mW; Voltage Rating: 50V; Temperature Coefficient: 100ppm/°C; Resistance: 0mR; Contact Plating: Tin; Height: 0.35mm; Radiation Hardening: No; Features: Automotive AEC-Q200; Composition: Thick Film; Width: 0.5mm; Weight: 2.3E-05oz; Termination: SMD/SMT; Packaging: Tape and Reel; Mount: Surface Mount; Case Code (Metric): 1005; Military Standard: Not; Min Operating Temperature: -55°C; Number of Terminations: 2; Package Quantity: 1; Case Code (Imperial): 0402; Depth: 0.5mm; Max Operating Temperature: 155°C; Case/Package: 0402; Power Rating: 63mW; Lead Free: Lead Free; Voltage Rating (DC): 50V; Length: 1mm
R13 R31 R33 = CMP-2002-01790-3: RES 10kΩ ±1% 0.063W 0402; Power Rating: 62.5mW; Voltage Rating: 50V; Temperature Coefficient: 100ppm/°C; Resistance: 10kR; Max Power Dissipation: 63mW; Tolerance: 1%; Military Standard: Not; Construction: Rectangular; Termination: SMD/SMT; Max Operating Temperature: 155°C; Min Operating Temperature: -55°C; Height: 0.015inch; Lead Free: Lead Free; Width: 0.02inch; Case/Package: 0402; Resistor Type: Thick Film; Series: AC; Features: Moisture Resistant; RoHS Compliant: Yes; Number of Terminations: 2; Case Code (Metric): 1005; Length: 0.039inch; Depth: 0.5mm; Size Code: 0402; Packaging: Tape and Reel; Case Code (Imperial): 0402
R30 = CMP-2002-04581-1: Manufacturer: KOA Speer; Part Number: SG73P1ETTP1001F
SW1 = CMP-011-00000-2: Tactile Switch, SPST-NO, 0.05 A, 12 V, -25 to 70 degC, 2-Pin SMD, RoHS, Tape and Reel; Manufacturer: Omron Electronic Components; IP Rating: IP40; Current Rating: 50mA; Max Contact Resistance: 100mohm; Operating Force: 153gf; Throw Configuration: SPST; Resistance: 0.1Ohm; Max Voltage Rating (DC): 12V; Contact Material: Silver; Max Current Rating: 50mA; Datasheet URL: http://www.omron.com/ecb/products/pdf/en-b3u.pdf; Mounting Technology: SM; Case/Package: B3U-1000; Packaging: TapeandReel; Package Reference: B3U-1000; Manufacturer URL: http://www.omron.com/; Datasheet Version: Jan-15; RoHS Compliant: True; Max Operating Temperature: 70°C; Contact Current Rating: 50mA; Package Quantity: 3500; Package Description: 2-Pin Surface Mount Device, Body 3 x 2.5 mm; Voltage Rating (DC): 12V; Min Operating Temperature: -25°C; Voltage Rating: 12V
SW2 = CMP-10038-000010-1: SWITCH SLIDE SPDT 300MA 6V; Electrical Life: 5000Cycles; Switch Function: On-On; Actuator Material: Nylon; Actuator Length: 2mm; Actuator Type: Standard; Current Rating: 300mA; Voltage Rating (DC): 6V; Min Operating Temperature: -40°C; Throw Configuration: SPDT; Mount: Surface Mount; Switch Travel: 2mm; Max Operating Temperature: 85°C; Packaging: Cut Tape; Contact Plating: Silver; Contact Material: Copper Alloy
U1 = SX1262IMLTRT: IC RF TxRx Only General ISM < 1GHz LoRaWAN 150MHz ~ 960MHz 24-VFQFN Exposed Pad; MF: Semtech Corporation; Value: *; SnapEDA_Link: https://www.snapeda.com/parts/SX1262IMLTRT/Semtech%20Corporation/view-part/2781045/?ref=snap; Availability: Unavailable; Package: VFQFN-24 Semtech; Price: None; MP: SX1262IMLTRT
U2 = CMP-19782-000002-1: IC FLASH 64MBIT SPI/QUAD 8SOIC; Address Bus Width: 24b; Memory Type: Non-Volatile; Memory Size: 64Mb; Page Size: 256B; Operating Supply Voltage: 3V; Interface: SPI; Frequency: 133MHz; Mount: Surface Mount; Max Operating Temperature: 105°C; Series: -; Packaging: Rail/Tube; Number of Pins: 8; Case/Package: SOIC; Min Operating Temperature: -40°C; Density: 64Mb
U3 = CMP-32859-000005-1: CMOS SWITCH
U4 = CMP-12105-000051-1: MAINSTREAM ARM CORTEX-M4 CORE WI; Manufacturer: STMicroelectronics; Ram Size: 128KBytes; Interface: I2C,SPI,UART,USART,CAN,USB,LIN,IrDA,I2S,SMBus,Other; Number Of I2C Channels: 4; Number Of A/D Converters: 5; Number Of Timers/Counters: 14; Number Of I/Os: 52; Max Supply Voltage: 3.6V; Memory Size: 512KBytes; Number Of Adc Channels: 26; Number Of Cores: 1; Min Supply Voltage: 1.71V; Max Junction Temp: +105°C; Standoff Height: 0.05mm; Number Of Uart Channels: 6; Number Of Spi Channels: 3; Frequency: 170MHz; Data Bus Width: 32bits; Memory Type: FLASH; Number Of Pwm Channels: 32; Package: LQFP64-5W; Manufacturer Part Number: STM32G474RET6; Height: 1.6mm; Mouser Description: Microcontroller 32-Bit ARM Cortex-M4 RISC 512KB Flash 1.71V to 3.6V 64-Pin LQFP; Temperature Range High: +105°C; Octopart: https://octopart.com/stm32g474ret6-stmicroelectronics-102308483; Category: IC; Automotive: No; ComponentLink2URL: https://www.st.com/resource/en/datasheet/stm32g474cb.pdf; Temperature Range Low: -40°C; Device Class L1: Integrated Circuits (ICs); Device Class L2: Embedded Processors and Controllers; Core Architecture: ARM Cortex-M4; Ambient Temperature Range Low: -40°C; ComponentLink2Description: Datasheet; Temperature: -40°C to +105°C; Digikey Description: MAINSTREAM ARM CORTEX-M4 CORE WI; Lead Free: Yes; RoHS: TRUE; Ambient Temperature Range High: +85°C; Device Class L3: Microcontrollers; Number Of Usb Channels: 1
Y1 = CMP-27762-001623-1: Crystal 32MHz ±10ppm 10pF SMD-4 3.2mm x 2.5mm; ESR (Equivalent Series Resistance): 40R; Frequency Tolerance: 10ppm; Max Operating Temperature: 70°C; RoHS Compliant: Yes; Frequency: 32MHz; Mount: Surface Mount; Width: 0.098inch; Min Operating Temperature: -20°C; Height: 0.028inch; Packaging: Tape and Reel; Frequency Stability: 10ppm; Length: 0.126inch; Package Quantity: 3000; Load Capacitance: 10pF; Case/Package: SMD/SMT
Y2 = CMP-27762-014373-1: Crystal 32.768kHz ±20ppm (Tol) 7pF FUND 70kΩ 2-Pin CSMD T/R; Insulation Resistance: 500MR; Series Resistance: 70kR; Mount: Surface Mount; Tolerance: 20ppm; Length: 3.2mm; Lead Free: Lead Free; Frequency: 32.768kHz; Frequency Tolerance: 20ppm; Frequency Stability: 20ppm; Load Capacitance: 7pF; Radiation Hardening: No; Package Quantity: 3000; Width: 1.5mm; Height: 0.9mm; Termination: SMD/SMT; Max Operating Temperature: 85°C; Number of Pins: 2; Operating Frequency: 32.768 kHz; ESR (Equivalent Series Resistance): 70kR; Packaging: Tape and Reel; Series: ABS07; Min Operating Temperature: -40°C; Depth: 1.5mm; Case/Package: CSMD
Y3 = CMP-003-00025-2: Resistance Weld Thru-Hole Crystal, 8 MHz, +/- 50 ppm, 10 pF, -20 to 70 degC, 2-Pin THD, RoHS, Bulk; Manufacturer: FOX Electronics; Load Capacitance: 20pF; Frequency Tolerance: 30ppm; Tolerance: 50ppm; ESR: 80; Resistance: 80Ohm; Frequency: 8MHz; Packaging: Bulk; Datasheet Version: Mar-15; Manufacturer URL: http://www.foxonline.com/; Package Reference: FOXSLF080-20; Max Operating Temperature: 70°C; Package Quantity: 100; RoHS Compliant: True; Pins: 2; Mounting Technology: TH; Package Description: 2-Pin Through Hole Device, Body 11.35 x 4.65 mm; Datasheet URL: http://download.siliconexpert.com/pdfs/2015/4/5/6/5/7/200/fox_/manual/35607121449963728hc49slf.pdf; Min Operating Temperature: -20°C; Case/Package: FOXSLF080-20